# Altium schematic sheet USB_interface.SchDoc: =DT_SCH_Title
size A4; Organization: Droid Technologies; SheetNumber: 15; SheetTotal: 15
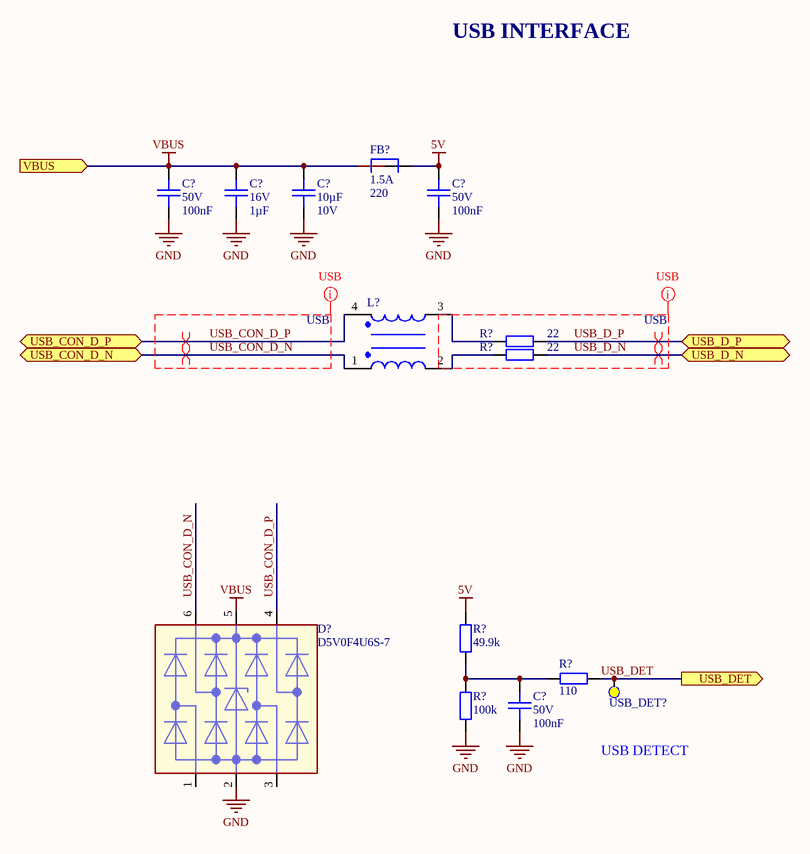
[diagram p0: USB_interface.SchDoc]

## Parts
(Parts that share a designator on the sheet are numbered #1, #2 ... from top to bottom, then left to right.)
C?#1  Voltage Rating: 50V  Capacitance: 100nF  [CAPC100x50x50L25]  (hidden comment: GCM155L8EH104KE07D)
C?#2  Voltage Rating: 16V  Capacitance: 1µF  [CAPC160X80X90L35]  (hidden comment: GCG188L8EE105KA07D)
C?#3  Capacitance: 10µF  Voltage Rating: 10V  [CAPC200X125X145L50]  (hidden comment: CGA4J1X8L1A106K125AC)
C?#4  Voltage Rating: 50V  Capacitance: 100nF  [CAPC100x50x50L25]  (hidden comment: GCM155L8EH104KE07D)
C?#5  Voltage Rating: 50V  Capacitance: 100nF  [CAPC100x50x50L25]  (hidden comment: GCM155L8EH104KE07D)
D?  D5V0F4U6S-7  [SOP6P65_200X210X90L85X20]
FB?  Imax: 1.5A  Impedance: 220  [BEADC160X80X95L40]  (hidden comment: BLM18KG221BH1D)
L?  2 Line Common Mode Choke  [DLW21HN900SQ2L]  (value not drawn)
R?#1  Resistance: 22  [RESC100X50X40L25]  (hidden comment: RC0402FR-0722RL)
R?#2  Resistance: 22  [RESC100X50X40L25]  (hidden comment: RC0402FR-0722RL)
R?#3  Resistance: 49.9k  [RESC100X50X40L25]  (hidden comment: RC0402FR-0749K9L)
R?#4  Resistance: 110  [RESC100X50X40L25]  (hidden comment: RC0402FR-07110RL)
R?#5  Resistance: 100k  [RESC100X50X40L25]  (hidden comment: RC0402FR-07100KL)
USB_DET?  TPAD  [PAD_1.0R]  (value not drawn)  (no BOM)

## Ports
USB_CON_D_N (bidir), USB_CON_D_P (bidir), USB_D_N (bidir), USB_D_P (bidir), USB_DET (out), VBUS (in)

## Nets
5V: C?#4.2 FB?.2 R?#3.2
GND: C?#1.1 C?#2.1 C?#3.1 C?#4.1 C?#5.1 D?.2 R?#5.1
VBUS: C?#1.2 C?#2.2 C?#3.2 D?.5 FB?.1 ; port VBUS
USB_CON_D_N: D?.6 L?.1 ; port USB_CON_D_N
USB_CON_D_P: D?.4 L?.4 ; port USB_CON_D_P
USB_D_N: R?#2.2 ; port USB_D_N
USB_D_P: R?#1.2 ; port USB_D_P
USB_DET: R?#4.2 USB_DET?.1(TPoint) ; port USB_DET
NetC?#5_2: C?#5.2 R?#3.1 R?#4.1 R?#5.2
NetL?_2: L?.2 R?#2.1
NetL?_3: L?.3 R?#1.1

Not connected (* = marked no-connect by the designer): D? 1 3

## Layout directives
differential pair: USB_CON_D_N, USB_CON_D_P, USB_D_N, USB_D_P
net class USB: USB_CON_D_N, USB_CON_D_P, USB_D_N, USB_D_P

## Notes on the sheet
- USB INTERFACE
- USB DETECT
- Title
- Size:
- A4
- Number:
- Revision:
- Date:
- Time:
- Sheet
- of

## Library data of the parts
C?#1 C?#4 C?#5 = CMP-001-1980-1: CAP CER 0.1UF 50V X8L 0402; Manufacturer: Murata Electronics; Op Temp max: 150°C; Op Temp min: -55°C; Tolerance: 10%; Height max: 550µm; ComponentLink3Description: Digikey; Mounting Type: SM; ComponentLink3URL: https://www.digikey.com/en/products/detail/murata-electronics/GCM155L8EH104KE07D/11618823; Package: 0402 (1005 Metric); Lead Spacing: 0mm; MPN: GCM155L8EH104KE07D; Size: 1.00mm x 0.50mm; Ratings: AEC-Q200; ComponentLink1URL: https://search.murata.co.jp/Ceramy/image/img/A01X/G101/ENG/GCM155L8EH104KE07-01.pdf; ComponentLink1Description: Datasheet; Dielectric: X8L; ComponentLink2Description: Mouser; ComponentLink2URL: https://eu.mouser.com/ProductDetail/Murata-Electronics/GCM155L8EH104KE07D?qs=1mbolxNpo8fQSHf0HYnZWw%3D%3D
C?#2 = CMP-001-1982-1: CAP CER 1UF 16V X8L 0603; Manufacturer: Murata Electronics; Tolerance: 10%; Op Temp min: -55°C; Op Temp max: 150°C; ComponentLink3URL: https://www.digikey.com/en/products/detail/murata-electronics/GCG188L8EE105KA07D/10695125; Package: 0603 (1608 Metric); MPN: GCG188L8EE105KA07D; ComponentLink2URL: https://eu.mouser.com/ProductDetail/Murata-Electronics/GCG188L8EE105KA07D?qs=rrS6PyfT74dFMfTR80dVTA%3D%3D; Dielectric: X8L; Size: 1.60mm x 0.80mm; ComponentLink1Description: Datasheet; ComponentLink1URL: https://search.murata.co.jp/Ceramy/image/img/A01X/G101/ENG/GCG188L8EE105KA07-01.pdf; ComponentLink2Description: Mouser; Height max: 900µm; Mounting Type: SM; ComponentLink3Description: Digikey; Lead Spacing: 0mm; Ratings: AEC-Q200
C?#3 = CMP-001-1984-1: CAP CER 10UF 10V X8L 0805; Manufacturer: TDK Corporation; Tolerance: 10%; Op Temp min: -55°C; Op Temp max: 150°C; ComponentLink3Description: Digikey; Mounting Type: SM; Ratings: AEC-Q200; ComponentLink1Description: Datasheet; ComponentLink3URL: https://www.digikey.com/en/products/detail/tdk-corporation/CGA4J1X8L1A106K125AC/9991388; Lead Spacing: 0mm; MPN: CGA4J1X8L1A106K125AC; Size: 2.00mm x 1.25mm; Height max: 1.5mm; ComponentLink2URL: https://eu.mouser.com/ProductDetail/TDK/CGA4J1X8L1A106K125AC?qs=gZXFycFWdANzH%252B2UvJJjtQ%3D%3D; Package: 0805 (2012 Metric); ComponentLink2Description: Mouser; Dielectric: X8L; ComponentLink1URL: https://product.tdk.com/system/files/dam/doc/product/capacitor/ceramic/mlcc/catalog/mlcc_automotive_hightemp_en.pdf
D? = CMP-001-1245-2: TVS DIODE 5.5VWM 12VC SOT363; Manufacturer: Diodes Incorporated; Cap @ Freq: 0.5pF @ 1MHz; Vc: 12V; Op Temp max: 150°C; Unidirectional Channels: 4; P: 200mW; Vbr: 6V; Vrwm: 5.5V; Op Temp min: -55°C; Height max: 1.1mm; ComponentLink3URL: https://www.digikey.com/en/products/detail/diodes-incorporated/D5V0F4U6S-7/7724995?s=N4IgTCBcDaICIFYBqAGAYgFgKoDYDKAtAOwgC6AvkA; Bidirectional Channels: -; Size: 2.15mm x 2.1mm; Mounting Type: SM; ComponentLink1Description: Datasheet; ComponentLink2Description: Mouser; Package: 6-TSSOP, SC-88, SOT-363; MPN: D5V0F4U6S-7; Ratings: -; ComponentLink1URL: https://www.diodes.com/assets/Datasheets/D5V0F4U6S.pdf; ComponentLink2URL: https://eu.mouser.com/ProductDetail/Diodes-Incorporated/D5V0F4U6S-7?qs=L1DZKBg7t5HMc2d93K7aHQ%3D%3D; ComponentLink3Description: Digikey
FB? = CMP-001-1981-1: FERRITE BEAD 220 OHM 0603 1LN; Manufacturer: Murata Electronics; DCR: 50m; Op Temp min: -55°C; Frequency: 100MHz; Op Temp max: 150°C; Number of Lines: 1; Mounting Type: SM; Size: 1.60mm x 0.80mm; ComponentLink2URL: https://eu.mouser.com/ProductDetail/Murata-Electronics/BLM18KG221BH1D?qs=sJ5gq5MLFXpgEHYBdWUtkQ%3D%3D; ComponentLink1Description: Datasheet; ComponentLink1URL: https://www.murata.com/en-us/products/productdata/8798137286686/QNFA9129.pdf; Lead Spacing: 0mm; Ratings: AEC-Q200; ComponentLink3Description: Digikey; ComponentLink3URL: https://www.digikey.com/en/products/detail/murata-electronics/BLM18KG221BH1D/6156000; Height max: 950µm; Package: 0603 (1608 Metric); ComponentLink2Description: Mouser; MPN: BLM18KG221BH1D
L? = AWCU00201212900M02: CMC 330MA 2LN 90OHM SMD AEC-Q200; Manufacturer: Pulse Electronics; MPN: AWCU00201212900M02
R?#1 R?#2 = CMP-001-0482-4: RES 22 OHM 1% 1/16W 0402; Manufacturer: YAGEO; Temperature Coefficient: ±100ppm; Op Temp max: 155°C; Op Temp min: -55°C; Power: 63mW; Ratings: -; ComponentLink3URL: https://www.digikey.com/en/products/detail/yageo/RC0402FR-0722RL/726562; ComponentLink2URL: https://eu.mouser.com/ProductDetail/YAGEO/RC0402FR-0722RL?qs=V1yeUXFNrkkRg6zf08ADKQ%3D%3D; MPN: RC0402FR-0722RL; ComponentLink1Description: Datasheet; ComponentLink3Description: Digikey; Tolerance: 1%; Size: 1.00mm x 0.50mm; ComponentLink1URL: https://www.yageo.com/upload/media/product/productsearch/datasheet/rchip/PYu-RC_Group_51_RoHS_L_12.pdf; Composition: Thick Film; ComponentLink2Description: Mouser; Mounting Type: SM; Package: 0402 (1005 Metric); Height max: 400µm
R?#3 = CMP-00547-4: RES 49.9K OHM 1% 1/16W 0402; Manufacturer: YAGEO; Temperature Coefficient: ±100ppm; Power: 63mW; Op Temp min: -55°C; Op Temp max: 155°C; ComponentLink1Description: Datasheet; Composition: Thick Film; Ratings: -; ComponentLink2URL: https://eu.mouser.com/ProductDetail/YAGEO/RC0402FR-0749K9L?qs=QT1cPpUoD8GsWnpgOWR2jA%3D%3D; ComponentLink3URL: https://www.digikey.com/en/products/detail/yageo/RC0402FR-0749K9L/726620; ComponentLink2Description: Mouser; MPN: RC0402FR-0749K9L; Package: 0402 (1005 Metric); Mounting Type: SM; ComponentLink1URL: https://www.yageo.com/upload/media/product/productsearch/datasheet/rchip/PYu-RC_Group_51_RoHS_L_12.pdf; Size: 1.00mm x 0.50mm; Tolerance: 1%; ComponentLink3Description: Digikey; Height max: 400µm
R?#4 = CMP-001-0497-6: RES 110 OHM 1% 1/16W 0402; Manufacturer: YAGEO; Power: 63mW; Op Temp min: -55°C; Op Temp max: 155°C; Temperature Coefficient: ±100ppm; Size: 1.00mm x 0.50mm; ComponentLink1Description: Datasheet; Package: 0402 (1005 Metric); ComponentLink2URL: https://eu.mouser.com/ProductDetail/YAGEO/RC0402FR-07110RL?qs=QWYorlrD8IXj7iGvwWbRbA%3D%3D; MPN: RC0402FR-07110RL; ComponentLink3Description: Digikey; Height max: 400µm; Ratings: -; ComponentLink3URL: https://www.digikey.com/en/products/detail/yageo/RC0402FR-07110RL/2827583; Composition: Thick Film; ComponentLink2Description: Mouser; Tolerance: 1%; Mounting Type: SM; ComponentLink1URL: https://www.yageo.com/upload/media/product/productsearch/datasheet/rchip/PYu-RC_Group_51_RoHS_L_12.pdf
R?#5 = CMP-00121-6: RES 100K OHM 1% 1/16W 0402; Manufacturer: YAGEO; Op Temp min: -55°C; Op Temp max: 155°C; Power: 63mW; Temperature Coefficient: ±100ppm; ComponentLink2Description: Mouser; Mounting Type: SM; Composition: Thick Film; ComponentLink3URL: https://www.digikey.com/en/products/detail/yageo/RC0402FR-07100KL/726526; Size: 1.00mm x 0.50mm; MPN: RC0402FR-07100KL; Tolerance: 1%; Ratings: -; ComponentLink1Description: Datasheet; ComponentLink2URL: https://eu.mouser.com/ProductDetail/YAGEO/RC0402FR-07100KL?qs=%2Fha2pyFaduhjtLcYvKXQ8IUndG0u%252BuCx1gxMxvN%252Btd7iB7mgHWsSbw%3D%3D; Package: 0402 (1005 Metric); ComponentLink1URL: https://www.yageo.com/upload/media/product/productsearch/datasheet/rchip/PYu-RC_Group_51_RoHS_L_12.pdf; ComponentLink3Description: Digikey; Height max: 400µm
USB_DET? = TPAD: Test Pad, SMD; Group: Test point